# EasyEDA Pro project ProPrj_轮腿机器人-世博同学-正式版.epro, board PCB_WLRobot
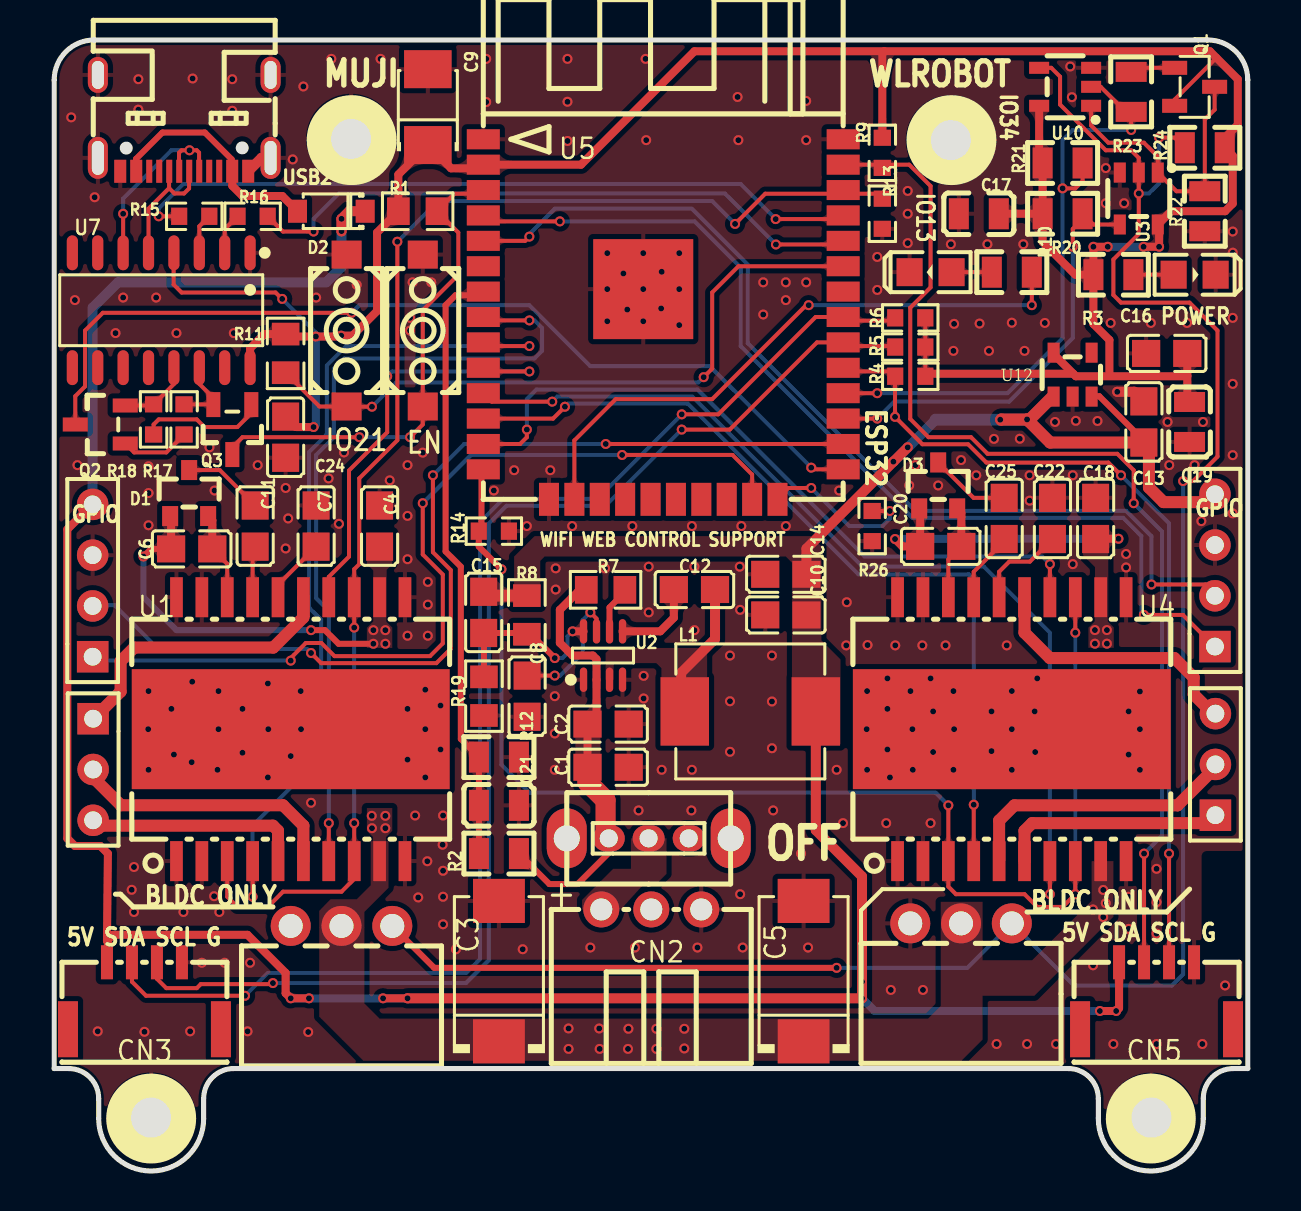
[diagram p9: board, top side]
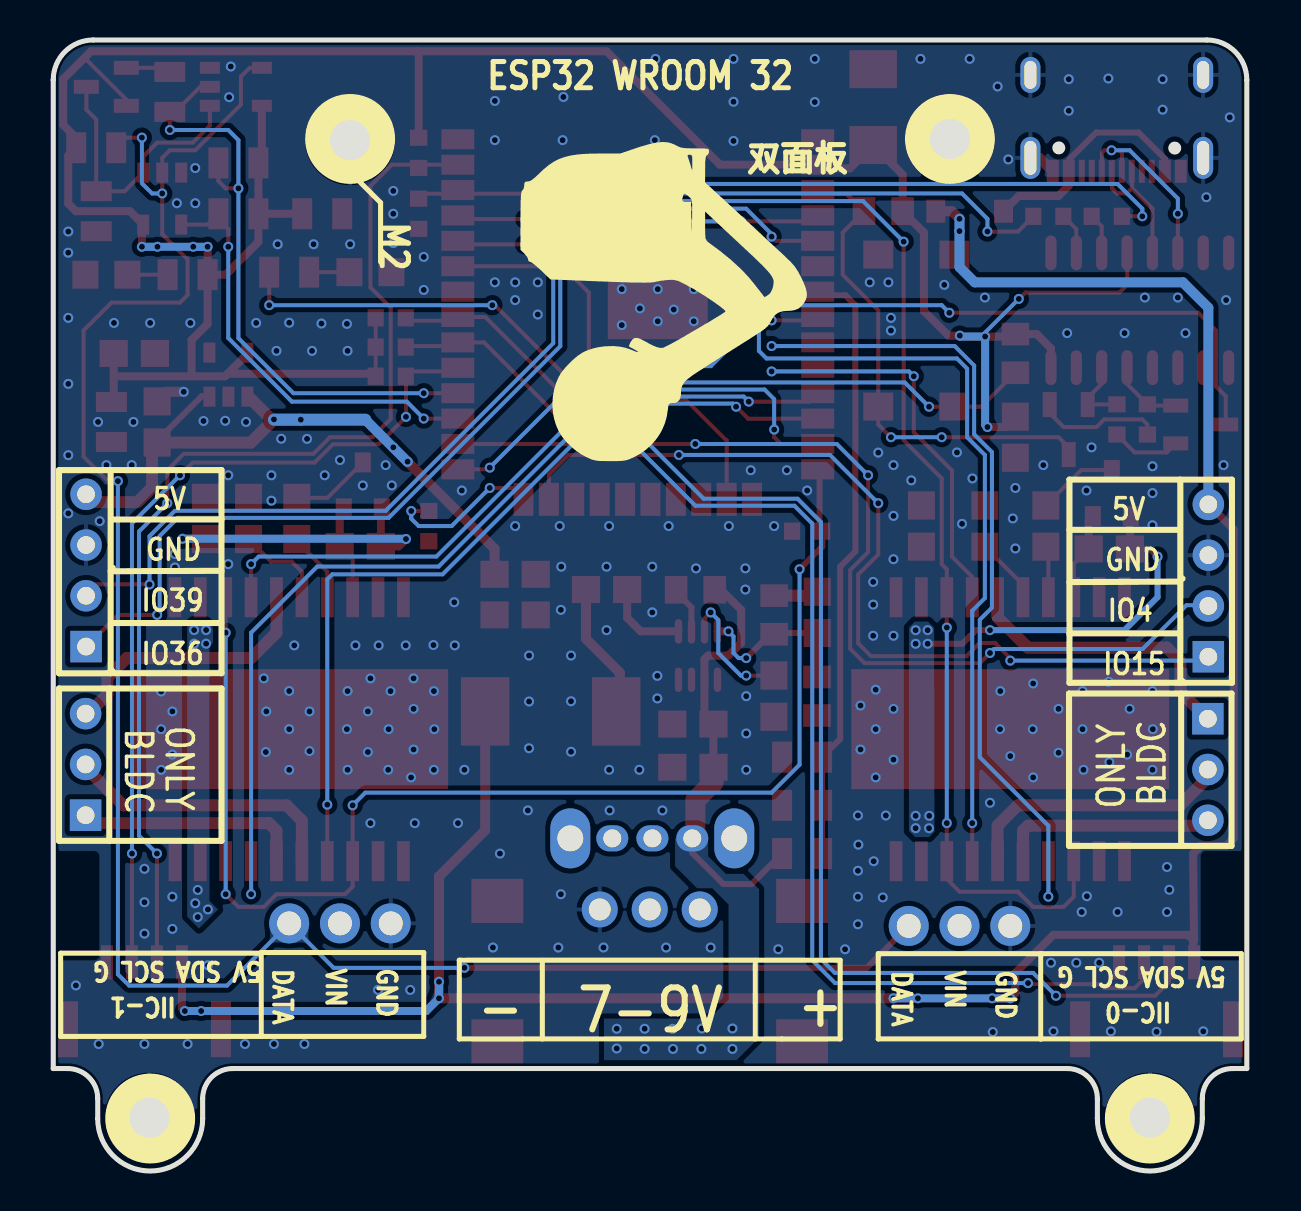
[diagram p10: board, bottom side, seen from below]

Outline 59.7 x 56.57 mm; copper layers: Top Layer, Bottom Layer. Coordinates in mm from the lower left corner of the outline.
Outline path: 0,54.57 0,5.12 0.72,5.12 arc(1.79,4.69) 2.22,3.62 2.22,2.62 arc(4.85,0) 7.47,2.62 7.47,3.62 arc(7.91,4.69) 8.97,5.12 50.72,5.12 arc(51.79,4.69) 52.22,3.62 52.22,2.62 arc(54.85,0) 57.47,2.62 57.47,3.62 arc(57.91,4.69) 58.97,5.12 59.7,5.12 59.7,54.57 arc(59.11,55.99) 57.7,56.57 2,56.57 arc(0.59,55.99) 0,54.57
Stack: Top Layer 0.035mm / Dielectric1 1.51mm FR4 er 4.5 / Bottom Layer 0.035mm

## Design rules (mm)
template: 用户自定义配置
spacing Default (default): track to track 0.152, other pairs 0 to 0.152
track width Default (default): min 0.19, default 0.254, max 25.4
differential pair differentialPair (default): width min 0.127, default 0.254, max 2.54; gap min 0.152, default 0.152
via Default (default): diameter min 0.45, default 0.61, max 100.025; hole min 0.25, default 0.305, max 59.995

## Placement (name value [footprint] x y rotation side)
C1  22uF  [C0805]  27.7 20.2 180 top
C2  0.1uF  [C0805]  27.7 22.35 180 top
C3  100uF  [CAP-SMD_L7.3-W4.3-R-RD]  22.24 10 270 top
C4  100nF  [C0805]  16.28 32.26 270 top
C5  100uF  [CAP-SMD_L7.3-W4.3-R-RD]  37.48 10 270 top
C6  220nF  [C0805]  6.88 31.12 0 top
C7  1uF  [C0805]  13.1 32.26 90 top
C8  0.1uF  [C0805]  23.65 23.75 90 top
C9  100uF  [CAP-SMD_L3.5-W2.8-R-RD]  18.69 53.22 270 top
C10  22uF  [C0805]  36.59 27.82 0 top
C11  10nF  [C0805]  10.05 32.26 90 top
C12  0.1uF  [C0805]  32.02 29.09 180 top
C13  10uF  [C0805]  54.5 37.47 270 top
C14  22uF  [C0805]  36.59 29.85 180 top
C15  33pF  [C0805]  21.48 27.94 270 top
C16  10uF  [C0805]  55.65 40.9 0 top
C17  0.1uF  [C0805#2]  46.25 47.88 180 top
C18  100nF  [C0805]  52.09 32.64 270 top
C19  0.1uF  [C0805#2]  56.79 37.47 270 top
C20  220nF  [C0805]  44.34 31.24 0 top
C21  0.1uF  [C0805#2]  22.24 18.29 180 top
C22  1uF  [C0805]  49.93 32.64 90 top
C24  0.1uF  [C0805]  11.58 36.71 90 top
C25  10nF  [C0805]  47.52 32.64 90 top
CN2  HX25003-3WAP  [CONN-TH_3P-P2.50_HX25003-3WAP]  29.86 13.08 0 top
CN3  A1257WV-S-4P  [CONN-SMD_A1257WV-S-4P]  4.51 8.77 0 top
CN5  A1257WV-S-4P  [CONN-SMD_A1257WV-S-4P]  55.14 8.77 0 top
CN7  SS-12D02-VG4  [SW-TH_SS-12D02-VG4]  29.74 16.64 0 top
D1  LBAT54SLT1G  [SOT-23_L2.9-W1.3-P1.90-LS2.4-BR]  6.75 33.91 270 top
D2  1N4007W  [SOD-123_L2.8-W1.8-LS3.7-RD]  13.86 48.01 180 top
D3  LBAT54SLT1G  [SOT-23_L2.9-W1.3-P1.90-LS2.4-BR]  44.22 34.29 270 top
H10  5264-3A  [CONN-TH_5264-3AW]  14.37 11.56 0 top
H11  5264-3A  [CONN-TH_5264-3AW]  45.36 11.69 0 top
J1  HDR-M-2.54_1x3  [HDR-M-2.54_1X3]  1.95 20.08 270 top
J2  HDR-M-2.54_1x4  [HDR-M-2.54_1X4]  58.06 30.04 90 top
J3  HDR-M-2.54_1x3  [HDR-M-2.54_1X3]  58.08 20.34 90 top
J4  HDR-M-2.54_1x4  [HDR-M-2.54_1X4]  1.92 29.53 90 top
KEY1  K2-3.6×6.1_SMD  [KEY-SMD_2P-L6.2-W3.6-LS8.0]  14.62 42.04 90 top
KEY2  K2-3.6×6.1_SMD  [KEY-SMD_2P-L6.2-W3.6-LS8.0]  18.43 42.04 90 top
L1  4.7uH  [IND-SMD_L7.3-W6.6]  34.82 22.99 180 top
LED1  LED-0805_R  [LED0805_RED]  57.04 44.83 0 top
LED2  LED-0805_B  [LED0805_BLUE]  43.83 44.96 180 top
NOREF  -  [Pad_e1567]  4.84 2.67 0 top
NOREF#2  -  [Pad_e1569]  44.85 51.56 0 top
NOREF#3  -  [Pad_e1566]  54.88 2.67 0 top
NOREF#4  -  [Pad_e1568]  14.85 51.62 0 top
Q1  SS8550-C148468  [SOT-23-3_L2.9-W1.3-P1.90-LS2.4-BR]  57.04 54.23 180 top
Q2  SS8050_C541705  [SOT-23-3_L2.9-W1.3-P1.90-LS2.4-BR#2]  2.3 37.34 0 top
Q3  SS8050_C541705  [SOT-23-3_L2.9-W1.3-P1.90-LS2.4-BR#2]  8.91 37.09 90 top
R1  10K  [R0805#2]  18.18 48.01 180 top
R2  3K/0.1%  [R0805]  22.24 15.88 0 top
R3  1K  [R0805]  52.98 44.83 0 top
R4  4.7K  [R0603]  42.82 39.75 0 top
R5  4.7K  [R0603]  42.82 41.21 0 top
R6  4.7K  [R0603]  42.82 42.67 0 top
R7  100k  [R0805#2]  27.58 29.07 0 top
R8  40.2k  [R0805#2]  23.64 27.82 90 top
R9  4.7K  [R0603]  41.42 50.93 90 top
R10  1K  [R0805]  47.9 44.96 180 top
R11  10K  [R0805#2]  11.58 40.9 90 top
R12  1k/0.1%  [R0805]  22.24 20.7 180 top
R13  4.7K  [R0603]  41.42 47.88 270 top
R14  4.7K  [R0603]  21.99 32.01 0 top
R15  1K  [R0603]  7 47.75 0 top
R16  1K  [R0603]  9.92 47.75 180 top
R17  10K  [R0603]  6.5 37.59 90 top
R18  10K  [R0603]  4.97 37.59 90 top
R19  5.49k  [R0805#2]  21.5 23.75 90 top
R20  10k  [R0805]  50.44 47.88 180 top
R21  10k  [R0805]  50.44 50.42 0 top
R22  10k  [R0805]  57.55 48.01 90 top
R23  10k  [R0805]  53.87 53.98 90 top
R24  10k  [R0805]  57.55 51.18 0 top
R26  4.7K  [R0603]  40.91 32.26 270 top
U1  L6234PD013TR  [POWERSO20_L15.9-W11.0-P1.27-LS14.2-BL-EP]  11.83 22.1 0 top
U2  MP2225GJ-Z  [TSOT-23-8_L2.9-W1.6-P0.65-LS2.8-BR]  27.45 25.78 270 top
U3  SN74LVC1G125DBVR  [SOT-23-5_L3.0-W1.7-P0.95-LS2.8-BR]  54.25 48.64 90 top
U4  L6234PD013TR  [POWERSO20_L15.9-W11.0-P1.27-LS14.2-BL-EP]  47.9 22.1 0 top
U5  ESP32-WROOM-32  [WIFIM-SMD_ESP-32S]  30.46 42.6 270 top
U7  CH340C  [SOP-16_L10.0-W3.9-P1.27-LS6.0-BL]  5.35 43.06 180 top
U10  SN74LVC1G126DBVR  [SOT-23-5_L3.0-W1.7-P0.95-LS2.8-BR]  50.56 54.23 0 top
U12  XC6210B332MR  [SOT-23-5_L2.9-W1.6-P0.95-LS2.8-BR]  50.94 39.83 270 top
USB2  TYPEC-304-ACP16  [USB-C-SMD_TYPE-C-16P-1]  6.5 52.42 180 top

## Footprints (pads in the part's own frame, mm; a bottom-side part is the same pattern mirrored in y, then rotated)
C0805
  rect 1.41x1.35 smd: 1(-1.03,0) 2(1.03,0)
C0805#2
  rect 1x1.55 smd: 1(-1,0) 2(1,0)
CAP-SMD_L3.5-W2.8-R-RD
  rect 1.9x2.376 smd: 1(1.899,0) 2(-1.899,0)
CAP-SMD_L7.3-W4.3-R-RD
  rect 2.208x2.592 smd: 1(3.511,0) 2(-3.511,0)
CONN-SMD_A1257WV-S-4P
  rect 0.6x1.7 smd: 1(1.875,1.675) 2(0.625,1.675) 3(-0.625,1.675) 4(-1.875,1.675)
  rect 1x2.8 smd: 5(3.825,-1.675) 6(-3.825,-1.675)
CONN-TH_3P-P2.50_HX25003-3WAP
  round 1.8 hole 1.1: 1(-2.5,0) 2(0.001,0) 3(2.5,0)
CONN-TH_5264-3AW
  round 2 hole 1.2x1: 1(2.54,0.7) 2(0,0.7) 3(-2.54,0.7)
HDR-M-2.54_1X3
  rect 1.575x1.575 hole 0.889: 1(-2.54,0)
  round 1.575 hole 0.889: 2(0,0) 3(2.54,0)
HDR-M-2.54_1X4
  rect 1.575x1.575 hole 0.889: 1(-3.81,0)
  round 1.575 hole 0.889: 2(-1.27,0) 3(1.27,0) 4(3.81,0)
IND-SMD_L7.3-W6.6
  rect 2.424x3.42 smd: 1(3.278,0) 2(-3.278,0)
KEY-SMD_2P-L6.2-W3.6-LS8.0
  rect 1.4x1.5 smd: 1(-3.8,0) 2(3.8,0)
LED0805_BLUE
  rect 1.3x1.399 smd: 1(-1.05,0) 2(1.05,0)
LED0805_RED
  rect 1.3x1.399 smd: 1(-1.05,0) 2(1.05,0)
Pad_e1566
  round 4 hole 2: 41(0,0)
Pad_e1567
  round 4 hole 2: 42(0,0)
Pad_e1568
  round 4 hole 2: 40(0,0)
Pad_e1569
  round 4 hole 2: 43(0,0)
POWERSO20_L15.9-W11.0-P1.27-LS14.2-BL-EP
  rect 0.635x2 smd: 1(-5.715,-6.6) 2(-4.445,-6.6) 3(-3.175,-6.6) 4(-1.905,-6.6) 5(-0.635,-6.6) 6(0.635,-6.6) 7(1.905,-6.6) 8(3.175,-6.6) 9(4.445,-6.6) 10(5.715,-6.6) 11(5.715,6.6) 12(4.445,6.6) 13(3.175,6.6) 14(1.905,6.6) 15(0.635,6.6) 16(-0.635,6.6) 17(-1.905,6.6) 18(-3.175,6.6) 19(-4.445,6.6) 20(-5.715,6.6)
  rect 15.9x6 smd: 21(0,0)
R0603
  rect 0.806x0.864 smd: 1(-0.753,0) 2(0.753,0)
R0805
  rect 1x1.55 smd: 1(-1,0) 2(1,0)
R0805#2
  rect 1.133x1.377 smd: 1(-0.966,0) 2(0.966,0)
SOD-123_L2.8-W1.8-LS3.7-RD
  rect 0.95x1.15 smd: 1(-1.692,0) 2(1.692,0)
SOP-16_L10.0-W3.9-P1.27-LS6.0-BL
  oval 0.56x1.745 smd: 1(-4.445,-2.873) 2(-3.175,-2.873) 3(-1.905,-2.873) 4(-0.635,-2.873) 5(0.635,-2.873) 6(1.905,-2.873) 7(3.175,-2.873) 8(4.445,-2.873) 9(4.445,2.873) 10(3.175,2.873) 11(1.905,2.873) 12(0.635,2.873) 13(-0.635,2.873) 14(-1.905,2.873) 15(-3.175,2.873) 16(-4.445,2.873)
SOT-23-3_L2.9-W1.3-P1.90-LS2.4-BR
  rect 1.25x0.7 smd: 1(1,-0.95) 2(1,0.95) 3(-1,0)
SOT-23-3_L2.9-W1.3-P1.90-LS2.4-BR#2
  rect 1.25x0.7 smd: 1(1.25,-0.95) 2(1.25,0.95) 3(-1.25,0)
SOT-23-5_L2.9-W1.6-P0.95-LS2.8-BR
  rect 1x0.6 smd: 1(1.1,-0.95) 2(1.1,0) 3(1.1,0.95) 4(-1.1,0.95) 5(-1.1,-0.95)
SOT-23-5_L3.0-W1.7-P0.95-LS2.8-BR
  rect 1x0.6 smd: 1(1.3,-0.95) 2(1.3,0) 3(1.3,0.95) 4(-1.3,0.95) 5(-1.3,-0.95)
SOT-23_L2.9-W1.3-P1.90-LS2.4-BR
  rect 1x0.8 smd: 1(1.15,-0.95) 2(1.15,0.95) 3(-1.15,0)
SW-TH_SS-12D02-VG4
  oval 1.6x1.3 hole 0.9: 1(-2,0) 2(-0.006,0) 3(2,0)
  oval 2x3 hole 1.3: 4(4.1,0) 5(-4.1,0)
TSOT-23-8_L2.9-W1.6-P0.65-LS2.8-BR
  oval 1.222x0.364 smd: 1(1.211,-0.975) 2(1.211,-0.325) 3(1.211,0.325) 4(1.211,0.975) 5(-1.211,0.975) 6(-1.211,0.325) 7(-1.211,-0.325) 8(-1.211,-0.975)
USB-C-SMD_TYPE-C-16P-1
  rect 0.6x1.15 smd: A1B12(-3.2,2.41) A4B9(-2.4,2.41) B1A12(3.2,2.41) B4A9(2.4,2.41)
  rect 0.3x1.15 smd: A5(-1.25,2.41) A6(-0.25,2.41) A7(0.25,2.41) A8(1.25,2.41) B5(1.75,2.41) B6(0.75,2.41) B7(-0.75,2.41) B8(-1.75,2.41)
  oval 1x2.1 hole 0.6x1.7: EP(-4.32,1.74) EP(4.32,1.74)
  oval 1x1.8 hole 0.6x1.4: EP(-4.32,-2.41) EP(4.32,-2.41)
WIFIM-SMD_ESP-32S
  rect 1x1.65 smd: 1(-9.005,-9) 2(-7.735,-9) 3(-6.465,-9) 4(-5.195,-9) 5(-3.925,-9) 6(-2.655,-9) 7(-1.385,-9) 8(-0.115,-9) 9(1.155,-9) 10(2.425,-9) 11(3.695,-9) 12(4.965,-9) 13(6.235,-9) 14(7.505,-9) 25(7.505,9) 26(6.235,9) 27(4.965,9) 28(3.695,9) 29(2.425,9) 30(1.155,9) 31(-0.115,9) 32(-1.385,9) 33(-2.655,9) 34(-3.925,9) 35(-5.195,9) 36(-6.465,9) 37(-7.735,9) 38(-9.005,9)
  rect 1.65x1 smd: 15(9.005,-5.715) 16(9.005,-4.445) 17(9.005,-3.175) 18(9.005,-1.905) 19(9.005,-0.635) 20(9.005,0.635) 21(9.005,1.905) 22(9.005,3.175) 23(9.005,4.445) 24(9.005,5.715)
  rect 5x5 smd: 39(-1.51,-1)

## Nets
As in the schematic, except:
GND: C1.1 C2.1 C3.2 C4.1 C5.2 C7.2 C8.1 C9.2 C10.1 C13.1 C14.2 C16.1 C17.2 C18.1 C19.2 C21.1 C22.2 C24.1 CN2.3 CN3.1 CN5.1 H10.3 H11.3 J2.3 J4.3 KEY1.2 KEY2.2 LED1.2 LED2.2 NOREF.42 NOREF#2.43 NOREF#3.41 NOREF#4.40 R12.1 R13.2 R14.2 R19.1 R22.1 R26.2 U1.1 U1.2 U1.10 U1.11 U1.19 U1.20 U1.21 U2.1 U2.4 U3.3 U4.1 U4.2 U4.10 U4.11 U4.19 U4.20 U4.21 U5.1 U5.15 U5.38 U5.39 U7.1 U10.3 U12.2 USB2.A1B12 USB2.B1A12 USB2.EP

Pads without a net: CN2 2; CN3 5 6; CN5 5 6; CN7 3 4 5; U5 17 18 19 20 21 22 32; U7 7 8 9 10 11 12 15; U12 4; USB2 A5 A8 B5 B8

## Via types
v1: diameter 0.5, hole 0.3, Top Layer to Bottom Layer, 392 vias

## Routing (per net, layer and track width the routed paths; a pad name or vN(x,y) marks a point on that pad's centre or on a via; arc(x,y) is an arc through that point)
GND: length 2.9
  Top Layer w0.508: C13.1 54.02,38.98 v1(53.17,38.98) ; USB2.EP 10.37,50.68 USB2.A1B12
  vias: v1(0.85,52.7) v1(1.03,43.56) v1(1.16,35.31) v1(2.02,48.71) v1(2.18,6.99) v1(3.07,41.91) v1(3.45,43.69) v1(3.88,14.07) v1(3.99,15.21) v1(3.99,12.96) v1(4.21,54.61) v1(4.21,53.09) v1(4.51,6.96) v1(4.72,35.25) v1(4.72,33.91) v1(4.72,32.3) v1(4.72,24.01) v1(4.7,22.1) v1(4.72,20.07) v1(5.1,43.69) v1(5.86,23.12) v1(5.99,20.83) v1(6.12,41.91) v1(6.46,12.96) v1(6.8,6.99) v1(6.92,54.65) v1(6.9,24.47) v1(6.88,20.45) v1(7.38,10.42) v1(7.77,36.2) v1(8.02,34.04) v1(8,13.75) v1(8.22,24.01) v1(8.22,22.1) v1(8.17,20.07) v1(8.26,12.96) v1(8.53,10.42) v1(8.91,54.61) v1(8.91,53.03) v1(8.98,41.91) v1(9.42,23.12) v1(9.42,20.92) v1(9.67,6.99) v1(9.8,10.42) v1(10.18,35.31) v1(10.69,24.39) v1(10.71,22.1) v1(10.69,19.69) v1(11.58,34.17) v1(11.58,31.14) v1(11.7,32.64) v1(11.83,20.76) v1(11.93,50.6) v1(12.33,24.01) v1(12.34,22.1) v1(12.46,54.25) v1(12.7,6.95) v1(12.85,18.42) v1(13.1,43.69) v1(13.72,34.64) v1(13.86,55.63) v1(14.24,32.37) v1(14.5,35.94) v1(15.13,44.33) v1(16.32,55.63) v1(16.78,34.55) v1(17.67,35.31) v1(17.67,32.77) v1(17.67,30.6) v1(17.67,26.77) v1(17.67,23.12) v1(17.67,20.58) v1(17.8,42.67) v1(17.8,42.04) v1(17.93,44.45) v1(18.05,17.78) v1(18.21,13.68) v1(18.43,35.93) v1(18.56,24.08) v1(18.56,22.1) v1(18.56,19.69) v1(18.69,29.47) v1(18.69,28.33) v1(18.69,26.77) v1(18.66,15.49) v1(18.86,44.45) v1(19.32,23.28) v1(19.32,21.08) v1(19.43,16.32) v1(19.45,17.78) v1(19.45,15.02) v1(19.45,13.72) v1(19.45,12.34) v1(20.09,11.09) v1(21.61,55.63) v1(21.61,53.47) v1(21.99,34.04) v1(23.01,35.05) v1(23.43,11.09) v1(23.64,32.26) v1(24.81,35.05) v1(25.08,30.15) v1(25.08,29.09) v1(25.04,23.75) v1(25.04,21.89) v1(25.04,20.07) v1(25.67,55.63) v1(25.67,53.48) v1(25.67,51.52) v1(25.91,32.26) v1(26.82,11.18) v1(27.55,30.15) v1(27.66,45.91) v1(27.66,44.11) v1(27.66,42.51) v1(28.47,44.9) v1(28.66,43.09) v1(28.92,32.26) v1(29.05,11.18) v1(29.23,18.04) v1(29.46,45.91) v1(29.46,44.11) v1(29.46,42.51) v1(29.48,24.77) v1(29.48,23.64) v1(29.58,55.63) v1(29.61,51.56) v1(29.74,30.23) v1(29.74,27.94) v1(30.38,44.98) v1(30.36,43.15) v1(30.38,20.07) v1(31.26,45.91) v1(31.26,44.11) v1(31.26,42.31) v1(31.9,32.26) v1(31.9,20.07) v1(31.87,18.04) v1(32.02,30.23) v1(32.02,27.05) v1(32.17,11.18) v1(33.8,25.78) v1(33.8,23.5) v1(33.8,20.97) v1(34.18,53.72) v1(34.22,51.56) v1(34.29,30.23) v1(34.31,28.07) v1(34.31,13.85) v1(34.37,32.26) v1(34.44,11.18) v1(35.46,44.45) v1(35.46,42.84) v1(35.9,25.78) v1(35.9,23.49) v1(35.9,21.15) v1(35.96,18.04) v1(36.59,44.45) v1(36.59,43.56) v1(36.59,32.26) v1(37.36,15.88) v1(37.61,53.53) v1(37.61,51.56) v1(37.61,44.45) v1(37.71,11.18) v1(39.13,20.07) v1(39.26,34.04) v1(39.45,17.4) v1(39.62,26.29) v1(39.64,28.45) v1(40.68,26.31) v1(40.66,24.01) v1(40.64,22.1) v1(40.66,20.07) v1(41.17,45.72) v1(41.17,44.07) v1(41.62,17.4) v1(41.67,24.64) v1(41.67,23.12) v1(41.67,21.08) v1(41.8,19.69) v1(41.85,9.06) v1(42.07,26.29) v1(42.69,49.02) v1(42.69,47.88) v1(42.69,46.41) v1(42.76,34.29) v1(42.83,24.01) v1(42.92,22.1) v1(42.94,20.07) v1(43.07,35.31) v1(43.42,26.29) v1(43.45,9.06) v1(43.83,24.64) v1(43.83,17.4) v1(43.96,22.99) v1(43.96,20.96) v1(44.22,34.29) v1(44.58,26.29) v1(44.85,46.36) v1(45.01,42.37) v1(44.98,41.02) v1(44.98,24.01) v1(45.01,22.1) v1(44.98,20.07) v1(45.36,35.56) v1(46.12,34.8) v1(46.28,42.39) v1(46.68,46.36) v1(46.75,41.02) v1(46.88,22.99) v1(46.88,21) v1(47,36.62) v1(47.14,6.35) v1(47.64,26.29) v1(47.9,42.43) v1(47.9,24.01) v1(47.9,22.1) v1(47.9,20.07) v1(48.3,36.63) v1(48.47,46.36) v1(48.53,41.02) v1(48.66,6.35) v1(48.79,34.8) v1(48.79,33.53) v1(49.04,22.99) v1(49.07,20.96) v1(49.17,24.64) v1(49.55,42.42) v1(50.06,37.47) v1(50.11,6.35) v1(50.82,55.25) v1(50.9,53.71) v1(50.95,34.8) v1(50.95,30.36) v1(51.1,37.52) v1(51.96,10.29) v1(52.18,37.52) v1(52.6,50.17) v1(52.6,48.41) v1(52.84,42.42) v1(52.98,6.35) v1(53.52,48.41) v1(53.61,30.86) v1(53.61,30.19) v1(53.74,22.99) v1(53.74,20.83) v1(53.74,13.72) v1(53.74,12.11) v1(54.3,23.99) v1(54.3,22.1) v1(54.3,20.07) v1(54.85,42.42) v1(55.14,15.12) v1(55.14,13.44) v1(55.14,11.88) v1(55.14,6.35) v1(55.69,37.47) v1(55.77,35.31) v1(56.66,42.42) v1(57.04,35.31) v1(57.38,32.51) v1(57.43,6.35) v1(57.46,37.47) v1(58.57,9.28) v1(58.95,46.99) v1(58.95,45.93) v1(58.95,42.67) v1(58.95,39.37) v1(58.95,35.81) v1(58.95,32.9)
VCC-3.3V: length 142
  Top Layer w0.2: R4.2 R5.2 R6.2 ; 5.97,45.93 5.97,44.34 6.37,43.94 11.07,43.94 11.38,43.64 ; 58.13,55.68 56.04,53.59 Q1.2
  Top Layer w0.4: 52.83,39.79 52.78,39.84 52.78,41.57 51.98,42.37 R3.1 ; R3.1 51.07,44.83 49.44,46.47 R20.2 ; R3.1 v1(51.98,46.23) 52.6,46.23 ; 41.51,56.01 32.02,56.01 26.35,50.34 U5.2 ; 41.51,56.01 57.8,56.01 58.13,55.68 59.2,54.61 59.2,52.33 58.55,51.68 R24.2 58.95,50.79 58.95,48.39 58.57,48.01 55.86,48.01 55.2,47.34 55.26,47.28 v1(55.26,46.23) 54.5,46.23 ; 41.51,56.01 41.42,55.92 R9.2 ; 50.97,39.88 49.93,40.92 ; 50.97,39.88 51.1,39.75 56.67,39.75 ; 50.97,39.88 43.7,39.88 ; C24.2 12.1,37.21 v1(12.97,37.21) ; R20.2 R21.1 49.26,50.59 U10.5 ; R20.2 C17.1 ; 56.67,39.75 56.67,38.58 C19.1 ; 56.67,39.75 C16.2 ; 21.37,50.16 19.85,50.16 C9.1 17.21,49.84 17.21,48.01 16.15,46.94 16.15,43.01 14.92,41.79 v1(14.35,41.79) 14.31,41.74 v1(13.09,41.74) 11.7,41.74 R11.2 10.51,41.86 9.8,41.15 U7.16
  Bottom Layer w0.2: v1(13.09,41.74) 13.09,41.94 v1(11.4,43.62)
  Bottom Layer w0.4: v1(12.97,37.21) 13.09,37.33 v1(13.09,41.74) 14.33,41.74 14.37,41.79 ; v1(55.26,46.23) v1(54.49,46.23) v1(52.7,46.23) v1(51.98,46.23)
VCC-5V: length 163.3
  Top Layer w0.3: 54.23,36.79 52.27,38.75 51.85,38.75
  Top Layer w0.4: CN5.4 53.26,8.15 v1(53.12,8) 52.34,8 ; 2.69,11.56 2.64,11.51 2.69,15.88 2.3,16.26 1.03,16.26 0.65,16.64 0.65,32.09 1.92,33.36 ; 2.69,11.56 2.94,11.81 9.67,11.81 11.58,9.91 11.58,8.89 v1(11.83,8.64) 12.72,8.64 ; 2.69,11.56 2.69,10.49 CN3.4 ; v1(17.67,8.64) 16.53,8.64
  Top Layer w0.5: C14.1 37.62,31.13 41.97,35.48 ; v1(41.97,35.48) v1(42.69,36.2) ; v1(17.67,8.64) v1(40.41,8.64) v1(40.41,9.47) 40.41,14.73 38.09,17.04 L1.2 ; D2.1 14.75,48.01 v1(14.37,47.63) 14.37,46.99
  Top Layer w0.6: 47.36,37.58 47.38,37.59 48.66,37.59 v1(48.66,37.59) 48.73,37.53 ; 48.73,37.53 49.9,38.7 ; 48.73,37.53 49.82,36.44 C13.2 54.76,36.18 54.76,34.19 55.49,33.46 57.67,33.46 ; 23.64,28.78 21.67,28.78 C15.1 ; 58.04,33.86 58.04,33.53
  Bottom Layer w0.4: v1(17.67,8.64) v1(16.45,8.64) v1(12.74,8.64) 11.96,8.64 ; v1(40.41,9.47) v1(40.41,8.64) 41.04,8 v1(52.3,8) v1(53.12,8)
  Bottom Layer w0.5: v1(41.97,35.48) 41.99,35.48 44.09,37.58 ; J4.4 1.92,43.18 3.19,44.45 13.61,44.45 14.37,45.21 v1(14.37,47.02) v1(14.37,47.63)
  Bottom Layer w0.6: 48.66,37.58 v1(47.32,37.58) 44.09,37.58
VIN: length 55
  Top Layer w0.3: CN7.1 27.74,15.91 26.18,14.35 24.77,14.35 R2.2 ; v1(4.46,30.74) 4.84,31.12 C6.1 ; v1(12.85,27.05) 13.54,27.05 14.22,26.37 v1(15.96,26.37)
  Top Layer w0.4: C1.2 C2.2 27.13,22.81 U2.2 27.13,25.6 26.94,25.78 25.93,25.78 25.29,26.42 25.29,28.07 26.18,28.96 26.61,28.96 ; C18.2 52.1,31.63 v1(53.23,31.63) ; D3.1 43.31,33.1 C20.1 42.42,31.24 v1(42.06,31.61) ; 5.8,32.76 5.85,32.71 C6.1
  Top Layer w1: CN7.1 27.58,16.8 27.58,18.55 26.67,19.45 C1.2
  Bottom Layer w0.3: v1(12.85,27.05) 6.12,27.05 4.46,28.7 v1(4.46,30.74)
  Bottom Layer w0.4: v1(53.23,31.63) 42.07,31.63 v1(42.06,31.61)
  vias: v1(15.88,17.77) v1(15.89,17.15) v1(15.96,27.05) v1(16.56,27.05) v1(16.56,26.37) v1(16.56,17.77) v1(16.56,17.15) v1(25.73,7.13) v1(25.73,6.11) v1(27.26,7.13) v1(27.28,6.11) v1(28.72,7.12) v1(28.7,6.11) v1(30.12,7.12) v1(30.12,6.11) v1(31.51,7.12) v1(31.51,6.13) v1(51.96,13.08) v1(52.05,27.06) v1(52.05,26.38) v1(52.47,14.06) v1(52.47,12.7) v1(52.6,13.4) v1(52.65,27.06) v1(52.65,26.38)
BAT_ADC: length 30.1
  Top Layer w0.3: 21.37,43.81 20.07,43.81 19.58,43.31 19.58,30.99 20.34,30.23 20.34,21.61 R12.2 C21.2 R2.1
D+: length 6.3
  Top Layer w0.2: U7.5 4.72,48.14 5.75,49.16 ; 5.75,49.16 6.01,48.9 6.5,48.9 6.75,49.15 6.75,49.89 ; 5.75,49.16 5.75,49.89
D-: length 10.2
  Top Layer w0.2: 6.25,49.89 6.24,49.9 6.24,50.93 6.37,51.06 v1(6.77,51.06) 7.13,51.06 7.25,50.94 7.25,49.89 ; v1(3.45,47.88) U7.6
  Bottom Layer w0.2: v1(3.45,47.88) 3.45,48.64 5.86,51.06 v1(6.77,51.06)
DATA: length 102.1
  Top Layer w0.2: R24.1 56.04,51.69 v1(55.26,51.69) ; v1(56.46,34.51) 56.96,34.51 58.19,35.73 58.19,42.04 56.79,43.44 53.36,43.44 52.98,43.82 52.98,45.6 54.25,46.87 v1(54.25,48.9) U3.2 54.25,50.68 53.87,51.06 52.6,51.06 50.31,53.34 50.31,54.74 49.87,55.18 49.26,55.18
  Top Layer w0.3: v1(39.13,10.16) 19.01,10.16 H10.1
  Bottom Layer w0.2: v1(55.26,51.69) 55.26,49.41 54.76,48.9 v1(54.25,48.9) ; v1(56.46,34.51) 56.46,9.84 55.9,9.27 51.01,9.27 H11.1 45.67,10.16 v1(39.13,10.16)
DTR: length 3.7
  Top Layer w0.2: U7.13 5.99,39.36 4.91,38.29 Q2.2
EN: length 24.8
  Top Layer w0.2: v1(15.26,36.71) 9.42,36.71 8.91,36.2 Q3.3 ; 21.37,48.89 20.02,48.89 R1.1 20.21,46.94 20.21,44.83 18.43,43.06 KEY2.1 18.43,37.34 v1(17.8,36.71)
  Bottom Layer w0.2: v1(15.26,36.71) v1(17.8,36.71)
IO0: length 46.7
  Top Layer w0.2: v1(14.88,42.93) 2.43,42.93 1.54,42.04 1.54,39.25 1.05,38.76 Q2.3 ; v1(37.87,35.18) 37.95,35.1 U5.25
  Bottom Layer w0.2: v1(37.87,35.18) 32.78,40.26 26.81,40.26 23.76,43.31 15.26,43.31 v1(14.88,42.93)
IO4: length 49.6
  Top Layer w0.2: v1(12.85,25.91) 13.35,25.4 19.11,25.4 19.84,26.13 19.84,30.06 18.94,30.95 v1(18.94,34.8) ; v1(27.59,36.37) U5.26
  Bottom Layer w0.2: v1(18.94,34.8) 20.51,36.37 v1(27.59,36.37) ; 1.93,28.3 3.02,28.3 5.21,26.11 12.65,26.11 v1(12.85,25.91)
IO15: length 45.1
  Top Layer w0.2: v1(28.41,35.82) 33.93,35.82 34.91,34.84 U5.23 ; v1(11.83,25.53) 11.83,25.66 12.59,26.41 13.36,26.41 14.02,25.75 18.8,25.75 19.44,26.4 19.44,29.84 18.43,30.84 v1(18.43,33.4)
  Bottom Layer w0.2: 1.96,25.77 2.2,25.53 v1(11.83,25.53) ; v1(28.41,35.82) 20.85,35.82 v1(18.43,33.4)
IO21: length 33.7
  Top Layer w0.2: R11.1 13.27,38.24 KEY1.1 14.63,38.23 v1(15.89,38.23) ; v1(32.48,39.71) 32.91,40.13 32.91,43.94 34.22,45.26 U5.33
  Bottom Layer w0.2: v1(15.89,38.23) 17.11,39.44 32.22,39.44 v1(32.48,39.71)
IO36: length 50.1
  Top Layer w0.2: v1(54.5,27.82) 56.45,27.82 58.06,26.21 ; U5.4 21.76,47.5 v1(25.29,47.5)
  Bottom Layer w0.2: v1(54.5,27.82) 54.38,27.94 54.38,31.76 53.47,32.67 42.93,32.67 34.34,41.26 34.34,45.2 32.03,47.5 v1(25.29,47.5)
IO39: length 49.1
  Top Layer w0.2: v1(54.88,29.34) 57.58,29.34 58.11,28.8 ; U5.5 23.56,46.53 v1(23.77,46.74)
  Bottom Layer w0.2: v1(54.88,29.34) 54.88,31.75 53.61,33.02 43.07,33.02 34.69,41.41 34.69,45.34 31.9,48.14 25.04,48.14 23.77,46.87 v1(23.77,46.74)
LED: length 30.3
  Top Layer w0.2: U5.16 26.02,36.54 28.09,38.61 32.91,38.61 37.61,43.31 v1(37.74,43.31) ; R10.1 v1(48.9,43.31)
  Bottom Layer w0.2: v1(37.74,43.31) v1(48.9,43.31)
M0_EN: length 68
  Top Layer w0.2: v1(34.06,47.37) 35.57,48.89 41.17,48.89 R13.1 ; v1(17.16,46.48) 17.16,36.55 15.26,34.65 15.26,30.36 15,30.1 U1.13 v1(15,27.18) ; U1.3 8.66,13.72 9.16,13.21 10.69,13.21 11.45,13.97 14.37,13.97 15,14.61 U1.8 v1(15,17.4)
  Bottom Layer w0.2: v1(15,27.18) v1(15,17.4) ; v1(17.16,46.48) 19.2,48.52 32.91,48.52 v1(34.06,47.37)
M0_IN1: length 40.4
  Top Layer w0.2: 21.37,42.54 21.38,42.55 v1(23.77,42.55) ; U1.7 v1(13.73,17.4)
  Bottom Layer w0.2: v1(13.73,17.4) 13.73,28.02 13.1,28.66 13.1,35.82 13.99,36.71 13.99,40.13 14.5,40.64 24.02,40.64 24.4,41.02 24.4,42.17 24.02,42.55 v1(23.77,42.55)
M0_IN2: length 43.3
  Top Layer w0.2: 21.37,41.27 v1(23.77,41.27) ; U1.4 v1(9.92,13.72)
  Bottom Layer w0.2: v1(23.77,41.27) 14.61,41.27 13.64,40.29 13.64,36.85 12.75,35.96 12.75,28.18 13.35,27.57 13.35,20.7 9.92,17.27 v1(9.92,13.72)
M0_IN3: length 21.9
  Top Layer w0.2: U1.14 13.73,29.72 14.75,30.73 14.75,35.04 16.66,36.95 v1(16.66,39.75) ; 21.37,40 v1(23.77,40)
  Bottom Layer w0.2: v1(16.66,39.75) 16.9,40 v1(23.77,40)
M0_OUT1: length 13.7
  Top Layer w0.6: 1.96,20.1 1.96,19.67 3.34,18.3 11.44,18.3 12.47,17.27 U1.6
M0_OUT2: length 11
  Top Layer w0.6: U1.5 11.19,17.02 10.94,17.27 2.21,17.27 1.96,17.53
M0_OUT3: length 14.5
  Top Layer w0.6: 1.97,22.63 3.32,23.98 3.32,25.5 4,26.18 10.96,26.18 12.47,27.69 U1.15
M1_EN: length 65.8
  Top Layer w0.2: U4.8 51.07,13.97 ; U4.13 v1(51.07,26.93) ; v1(44.72,18.29) U4.3 44.72,14.23 45.1,13.85 48.53,13.85 49.17,13.21 50.44,13.21 v1(51.07,13.85)
  Top Layer w0.3: v1(22.37,30.1) 21.24,31.24 R14.1 21.37,32.14 21.37,34.92
  Bottom Layer w0.2: v1(44.72,18.29) 44.09,18.93 23.77,18.93 22.37,20.32 v1(22.37,30.1) ; v1(51.07,13.85) v1(51.07,26.93)
M1_IN1: length 48.3
  Top Layer w0.2: U4.7 v1(49.8,13.85) ; U5.11 21.89,38.48 v1(24.91,38.48)
  Bottom Layer w0.2: v1(24.91,38.48) 25.17,38.74 31.92,38.74 40.42,30.24 46.49,30.24 49.8,26.93 v1(49.8,13.85)
M1_IN2: length 42.6
  Top Layer w0.2: v1(25.55,38.23) 24.95,37.64 U5.12 ; U4.4 v1(45.99,18.32)
  Bottom Layer w0.2: v1(45.99,18.32) 45.99,29.59 45.74,29.85 40.22,29.85 31.68,38.39 25.7,38.39 v1(25.55,38.23)
M1_IN3: length 35.9
  Top Layer w0.2: U5.13 23.3,36.37 23.64,36.71 v1(23.64,37.09) ; U4.14 v1(49.8,30.36)
  Bottom Layer w0.2: v1(49.8,30.36) 49.42,30.74 40.53,30.74 32.18,39.09 24.12,39.09 23.64,38.61 v1(23.64,37.09)
M1_OUT1: length 11.4
  Top Layer w0.6: 58.02,17.9 57.53,17.4 48.91,17.4 48.53,17.02 U4.6
M1_OUT2: length 13.4
  Top Layer w0.6: U4.5 47.26,17.53 48.03,18.29 56.19,18.29 57.69,19.79
M1_OUT3: length 13.7
  Top Layer w0.6: U4.15 48.53,26.93 49.8,25.66 56.03,25.66 56.99,24.69 56.99,23.84 58.06,22.78 58.06,22.59
RTS: length 3.6
  Top Layer w0.2: 6.5,38.35 7.95,38.35 Q3.2 7.96,38.67 7.26,39.37 7.26,40.18
RXD0: length 31.2
  Top Layer w0.2: 36.09,46.36 v1(36.1,46.35) 39.37,46.35 ; R16.1 11.44,46.99 v1(12.97,46.99)
  Bottom Layer w0.2: v1(36.1,46.35) 33.55,48.9 14.24,48.9 12.97,47.63 v1(12.97,46.99)
SCL_0: length 64.2
  Top Layer w0.2: U5.30 38.15,41.45 33.79,37.09 v1(31.39,37.09) ; 39.37,41.27 42.01,41.27 R5.1 ; v1(10.94,9.4) 10.89,9.35 7.33,9.35 7.13,9.15 5.61,9.15 5.14,9.61 CN3.2
  Bottom Layer w0.2: v1(10.94,9.4) 20.59,9.4 21.74,10.54 21.74,32.39 22.62,33.28 27.58,33.28 v1(31.39,37.09)
SCL_1: length 42.8
  Top Layer w0.2: 42.06,39.76 41.82,40 39.37,40 ; 42.06,39.76 R4.1 ; 42.06,39.76 v1(42.06,37.72) 43.42,36.35 45.71,36.35 46.63,35.44 52.72,35.44 v1(53.36,34.8) ; 42.06,39.76 42.06,39.87 ; CN5.2 v1(55.76,15.88)
  Bottom Layer w0.2: v1(55.76,15.88) 55.76,32.4 v1(53.36,34.8)
SDA_0: length 66.5
  Top Layer w0.2: v1(31.39,37.85) 33.22,37.85 38.09,42.72 U5.31 ; R6.1 41.93,42.54 39.37,42.54 ; v1(9.54,8.77) 4.59,8.77 3.89,9.47 CN3.3
  Bottom Layer w0.2: v1(31.39,37.85) 27.17,33.63 22.47,33.63 21.3,32.46 21.3,10.61 20.6,9.91 10.69,9.91 v1(9.54,8.77)
SDA_1: length 54.9
  Top Layer w0.2: CN5.3 v1(54.51,15.88) ; v1(53.99,33.4) 53.99,35.05 53.17,35.88 46.69,35.88 45.86,36.71 43.73,36.71 42.82,37.62 42.82,43.18 43.83,44.2 43.83,49.27 42.77,50.34 40.07,50.34 39.89,50.16 39.37,50.16
  Bottom Layer w0.2: v1(54.51,15.88) 55.41,16.78 55.41,31.99 v1(53.99,33.4)
SERVO_RX: length 21.7
  Top Layer w0.2: U5.27 v1(41.17,37.64) ; U3.4 51.98,47.34 R20.1 51.44,47.61 50.95,47.12 v1(50.95,46.23)
  Bottom Layer w0.2: v1(50.95,46.23) 50.95,41.67 47.76,38.48 42.01,38.48 v1(41.17,37.64)
SERVO_TX: length 31.1
  Top Layer w0.2: U10.2 52.34,54.23 53.6,52.98 R23.1 v1(53.87,52.07) ; R21.2 51.44,49.52 51.07,49.15 v1(50.44,49.15) ; U5.28 v1(41.17,38.91)
  Bottom Layer w0.2: v1(41.17,38.91) 47.69,38.91 50.44,41.66 v1(50.44,49.15) 50.44,51.56 50.95,52.07 v1(53.87,52.07)
TXD0: length 36.8
  Top Layer w0.2: R15.1 v1(5.23,47.75) ; 39.37,47.62 v1(36.09,47.62)
  Bottom Layer w0.2: v1(5.23,47.75) 5.23,48.14 6.46,49.37 34.33,49.37 v1(36.09,47.62)
TXEN: length 13.9
  Top Layer w0.2: Q1.3 58.04,53.09 57.55,52.6 R22.2 56.13,49.01 55.2,49.94 55.2,50.74 54.5,51.44 52.72,51.44 51.87,52.3 U10.1
$1N79: length 4.6
  Top Layer w0.2: C22.1 48.8,30.48 47.77,30.48 47.26,29.97 U4.16
$1N80: length 3.3
  Top Layer w0.2: U1.16 11.19,29.33 C7.1
$1N145: length 4.5
  Top Layer w0.2: C6.2 8.66,30.37 U1.18
  Top Layer w0.4: D1.2 7.91,32.55 C6.2
$1N146: length 2.6
  Top Layer w0.2: U1.17 9.92,31.1 C11.1
$1N187: length 4.8
  Top Layer w0.2: U4.18 44.72,30.6 C20.2
  Top Layer w0.4: C20.2 45.37,32.94 D3.2
$1N188: length 3.5
  Top Layer w0.2: U4.17 45.99,29.97 47.52,31.5 C25.1
$1N369: length 8.1
  Top Layer w0.2: v1(37.87,34.17) 36.72,34.17 36.18,33.62 U5.24 ; 41.8,33.02 v1(41.79,33.01) R26.1
  Bottom Layer w0.2: v1(37.87,34.17) 39.77,32.26 41.42,32.26 41.79,32.63 v1(41.79,33.01)
$1N417: length 2
  Top Layer w0.2: R3.2 LED1.1
$1N643: length 2.3
  Top Layer w0.3: 28.54,28.96 27.78,28.19 U2.6
$1N654: length 6.3
  Top Layer w0.2: U2.7 27.13,27.63 26.94,27.82 ; C8.2 v1(25.04,24.78)
  Bottom Layer w0.2: v1(25.04,24.78) 25.31,24.78 26.44,25.91 26.44,27.56 v1(26.82,27.94)
$1N667: length 5.8
  Top Layer w0.5: 31.36,23.96 31.36,24.92 33.05,26.62 C12.1
$1N694: length 4.1
  Top Layer w0.4: U2.5 30.31,26.99 30.99,27.67 30.99,28.96
$1N701: length 8.8
  Top Layer w0.3: R19.2 21.5,26.9 C15.2 23.58,26.91 23.64,26.85 23.84,26.85 v1(25.04,25.66)
  Top Layer w0.4: U2.8 v1(25.93,26.99)
  Bottom Layer w0.2: v1(25.93,26.99) 25.67,26.74 25.67,25.91 25.42,25.66 v1(25.04,25.66)
$1N796: length 2.3
  Top Layer w0.2: 56.04,55.18 54.07,55.18 R23.2
$1N976: length 2
  Top Layer w0.2: 44.88,44.96 R10.2
$1N1274: length 2
  Top Layer w0.2: 7.26,45.93 7.26,47.26 R15.2
$1N1275: length 2.1
  Top Layer w0.2: R16.2 8.53,47.11 U7.2
$1N1361: length 4
  Top Layer w0.2: C11.2 8.28,35.06 D1.3
$1N1362: length 4
  Top Layer w0.2: C25.2 45.99,33.67 D3.3
$1N1380: length 3.5
  Top Layer w0.2: Q2.1 4,35.94 5.61,35.94 6.5,36.83 R17.1
$1N1381: length 6.4
  Top Layer w0.2: R18.1 4.97,37.34 5.23,37.59 7.13,37.59 7.51,37.21 9.16,37.21 9.86,37.91 Q3.1
$1N13794: length 11.7
  Top Layer w0.3: 8.78,50.01 8.9,49.89 ; 8.88,50.11 8.88,50.6 7.54,51.95 5.41,51.95 4.1,50.63 4.1,49.89
  Top Layer w0.4: D2.2 11.41,48.77 9.42,48.77 8.91,49.28 8.91,49.88 8.9,49.89

## Copper pours and planes (outline as drawn; the poured copper is in the pictures)
GND on Top Layer: -3.66,59.17 61.68,59.17 61.68,1.7 -3.66,1.7
GND on Bottom Layer: -3.7,58.32 61.55,58.32 61.55,2.35 -3.7,2.35
VCC-5V on Top Layer: 36.9,30.48 39.33,30.48 39.33,21.36 36.9,21.36
VCC-5V on Top Layer: 23,31.76 38.37,31.76 38.37,28.23 23,28.23
VIN on Top Layer: 51.73,29.71 53,29.71 53,26.17 51.73,26.17
VIN on Top Layer: 13.25,13.46 46.44,13.46 46.44,5.51 13.25,5.51
VIN on Top Layer: 46.12,15.5 52.98,15.5 52.98,8.77 46.12,8.77
VIN on Top Layer: 13.25,16.5 16.72,16.5 16.72,12.17 13.25,12.17
VIN on Top Layer: 15.64,29.7 16.91,29.7 16.91,26.16 15.64,26.16
VIN on Top Layer: 51.45,32.27 52.72,32.27 52.72,27.72 51.45,27.72
VIN on Top Layer: 26.06,22.33 27.32,22.33 27.32,20.2 26.06,20.2
VIN on Top Layer: 15.64,31.94 16.91,31.94 16.91,27.7 15.64,27.7
VIN on Top Layer: 15.64,18.15 16.91,18.15 16.91,14.49 15.64,14.49
VIN on Bottom Layer: 51.45,27.5 53,27.5 53,12.13 51.45,12.13
VIN on Bottom Layer: 24.39,16.64 32.15,16.64 32.15,5.55 24.39,5.55
VIN on Bottom Layer: 15.63,27.48 16.9,27.48 16.9,16.7 15.63,16.7
$1N667 on Top Layer: 27.58,26.16 32.66,26.16 32.66,21.47 27.58,21.47
$1N1373 on Top Layer: 26.4,16.64 30.63,16.64 30.63,13.08 26.4,13.08

Small or netless copper shapes (teardrops, artwork), in the pictures only: 227 on Top Layer, 65 on Bottom Layer

## Text on the board
Bottom Silkscreen Layer: GND | VIN | DATA | 5V SDA SCL G | IIC-0 | IIC-1 | 5V | IO4 | IO15 | IO39 | IO36 | ONLY | BLDC | M2 | ESP32 WROOM 32 | + | - | 7-9V | 双面板
Top Silkscreen Layer: WIFI WEB CONTROL SUPPORT | POWER | GPIO | IO34 | 5V SDA SCL G | IO13 | BLDC ONLY | ESP32 | IO21 | EN | WLROBOT | MUJI | + | OFF
